# Altium schematic sheet a0206-2006.2.SchDoc
size 558 x 431 mm
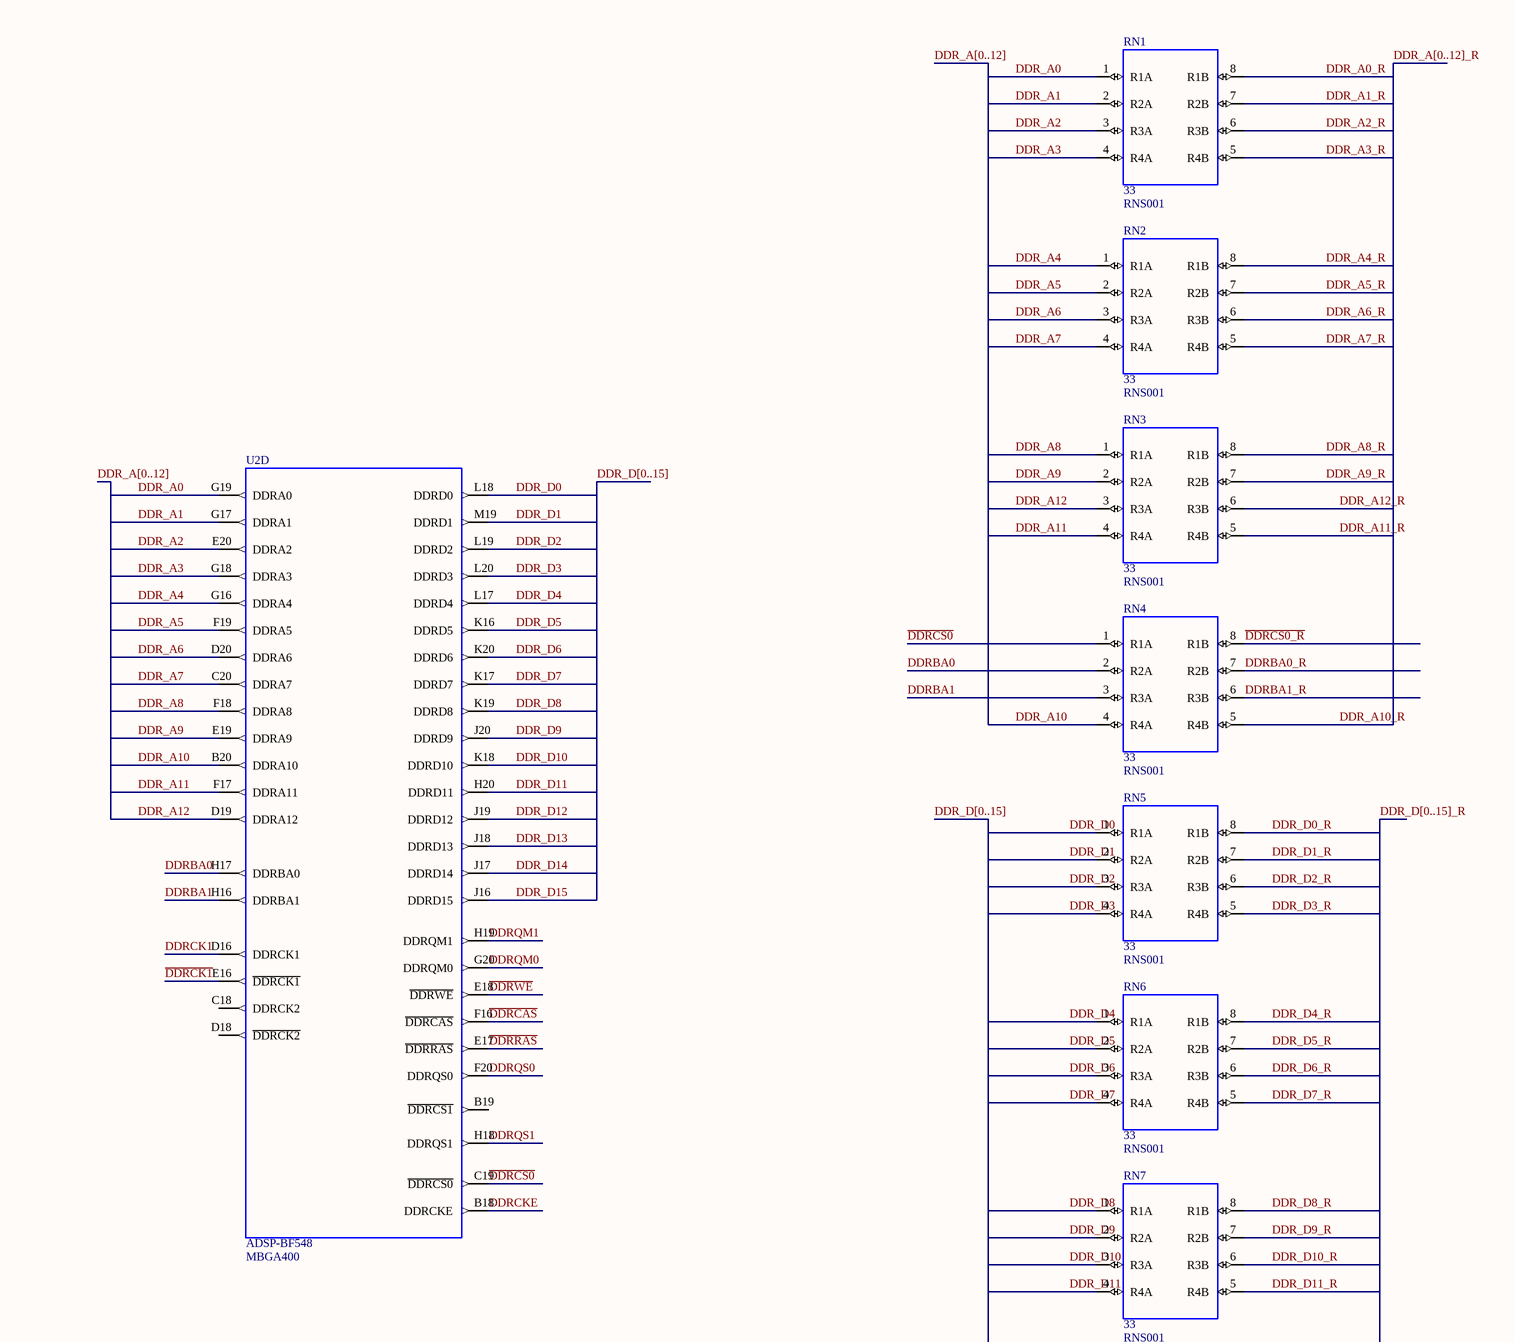
[diagram p0: a0206-2006.2.SchDoc, top left]
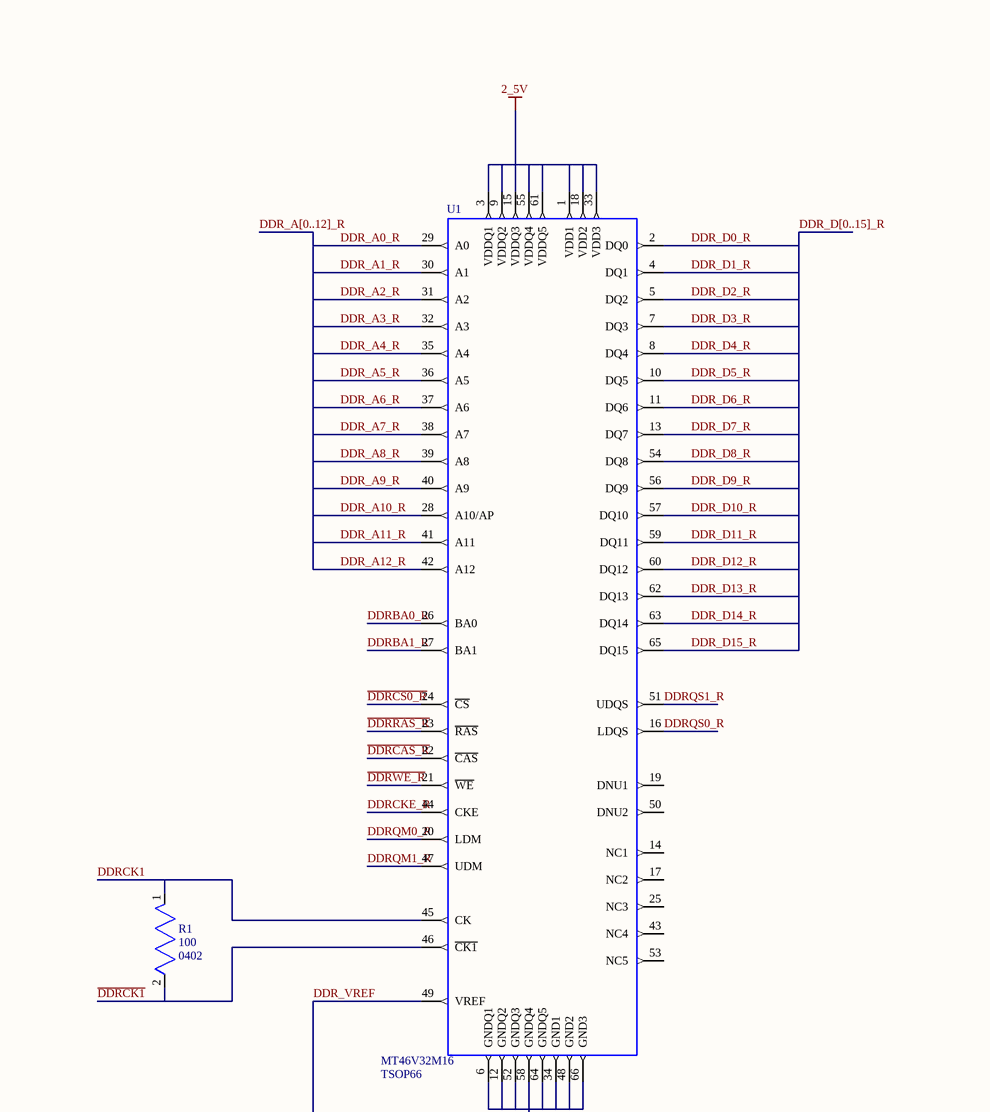
[diagram p1: a0206-2006.2.SchDoc, top right]
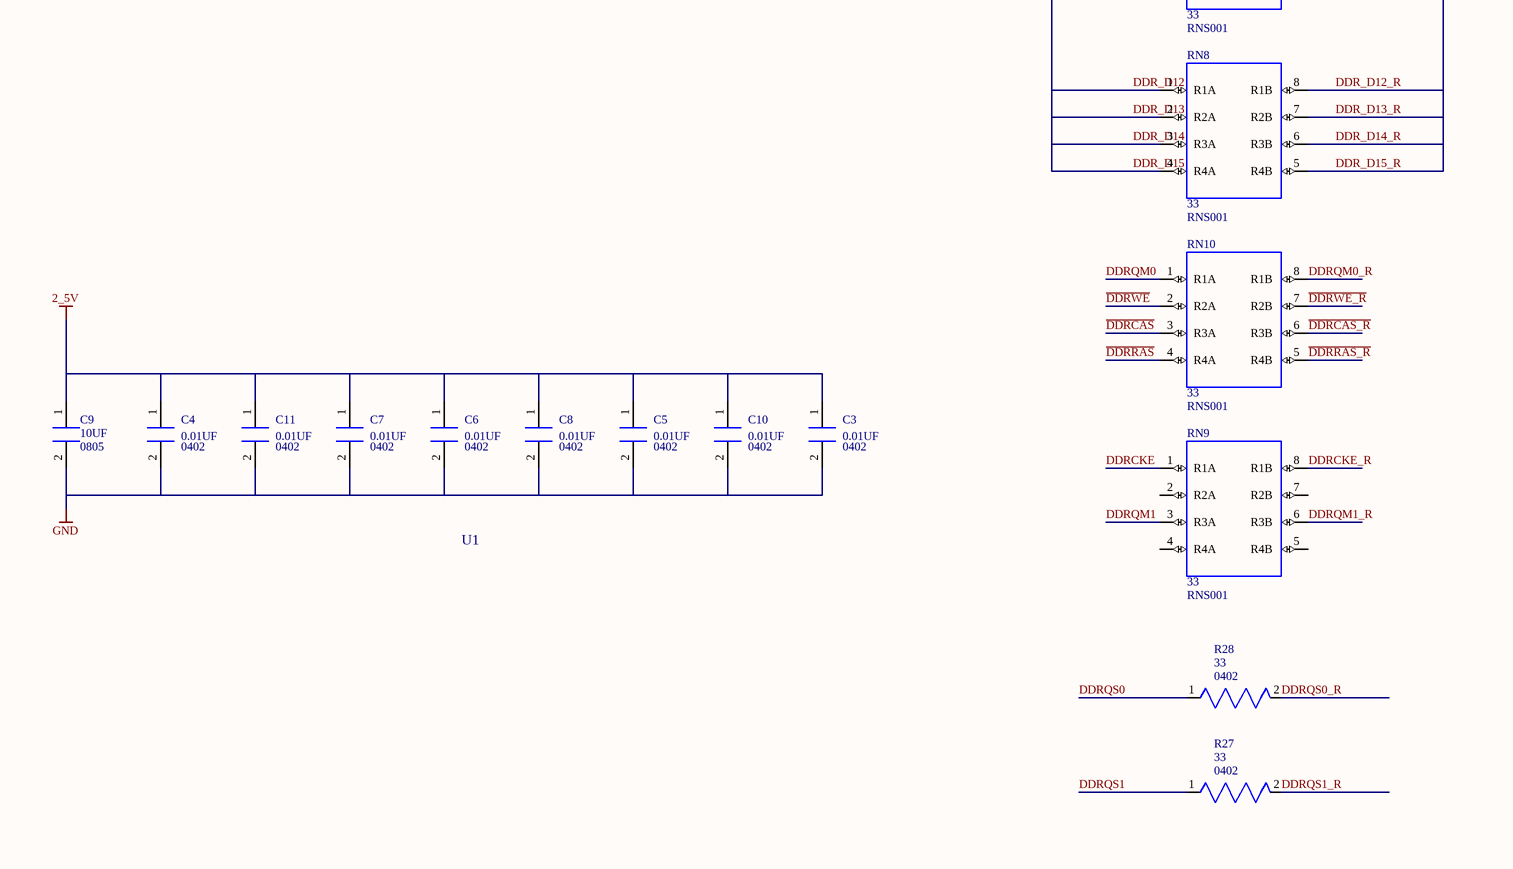
[diagram p2: a0206-2006.2.SchDoc, bottom left]
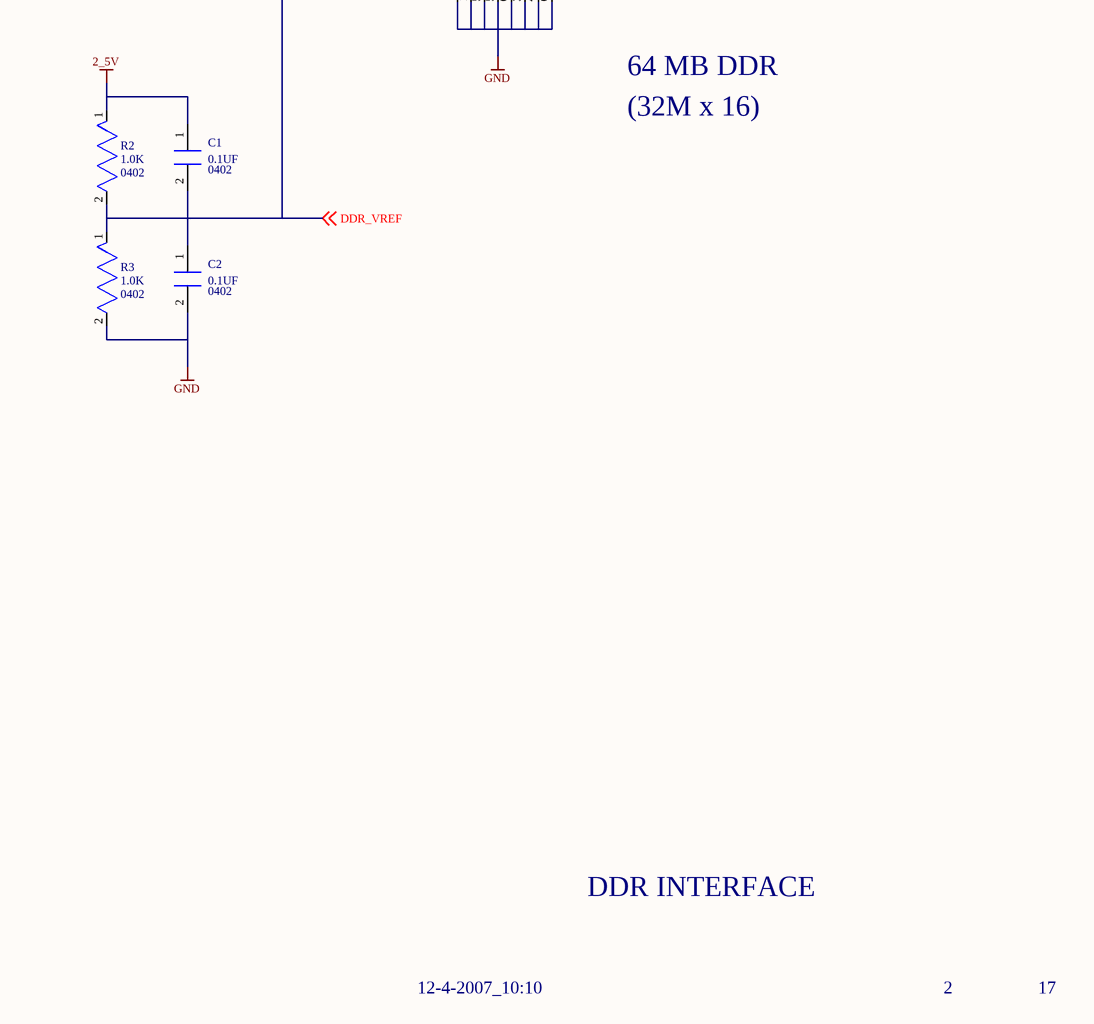
[diagram p3: a0206-2006.2.SchDoc, bottom right]

## Parts
C1  value 0.1UF  [0402]  (hidden comment: *)
C2  value 0.1UF  [0402]  (hidden comment: *)
C3  value 0.01UF  [0402]  (hidden comment: *)
C4  value 0.01UF  [0402]  (hidden comment: *)
C5  value 0.01UF  [0402]  (hidden comment: *)
C6  value 0.01UF  [0402]  (hidden comment: *)
C7  value 0.01UF  [0402]  (hidden comment: *)
C8  value 0.01UF  [0402]  (hidden comment: *)
C9  value 10UF  [0805]  (hidden comment: *)
C10  value 0.01UF  [0402]  (hidden comment: *)
C11  value 0.01UF  [0402]  (hidden comment: *)
R1  value 100  [0402]  (hidden comment: *)
R2  value 1.0K  [0402]  (hidden comment: *)
R3  value 1.0K  [0402]  (hidden comment: *)
R27  value 33  [0402]  (hidden comment: *)
R28  value 33  [0402]  (hidden comment: *)
RN1  value 33  [RNS001]  (hidden comment: *)
RN2  value 33  [RNS001]  (hidden comment: *)
RN3  value 33  [RNS001]  (hidden comment: *)
RN4  value 33  [RNS001]  (hidden comment: *)
RN5  value 33  [RNS001]  (hidden comment: *)
RN6  value 33  [RNS001]  (hidden comment: *)
RN7  value 33  [RNS001]  (hidden comment: *)
RN8  value 33  [RNS001]  (hidden comment: *)
RN9  value 33  [RNS001]  (hidden comment: *)
RN10  value 33  [RNS001]  (hidden comment: *)
U1  PART: MT46V32M16  [TSOP66]  (hidden comment: *)
U2  PART: ADSP-BF548  PKG_TYPE: MBGA400  (hidden comment: ICS_ADSPBF548)  (part D of 7)

## Nets
2_5V: C1.1(A) C3.1(A) C4.1(A) C5.1(A) C6.1(A) C7.1(A) C8.1(A) C9.1(A) C10.1(A) C11.1(A) R2.1(N1) U1.1(VDD1) U1.3(VDDQ1) U1.9(VDDQ2) U1.15(VDDQ3) U1.18(VDD2) U1.33(VDD3) U1.55(VDDQ4) U1.61(VDDQ5)
GND: C2.2(B) C3.2(B) C4.2(B) C5.2(B) C6.2(B) C7.2(B) C8.2(B) C9.2(B) C10.2(B) C11.2(B) R3.2(N2) U1.6(GNDQ1) U1.12(GNDQ2) U1.34(GND1) U1.48(GND2) U1.52(GNDQ3) U1.58(GNDQ4) U1.64(GNDQ5) U1.66(GND3)
~{DDRCAS}: RN10.3(R3A) U2.F16(~{DDRCAS})
~{DDRCAS_R}: RN10.6(R3B) U1.22(~{CAS})
~{DDRCK1}: R1.2(N2) U1.46(~{CK1}) U2.E16(~{DDRCK1})
~{DDRCS0}: RN4.1(R1A) U2.C19(~{DDRCS0})
~{DDRCS0_R}: RN4.8(R1B) U1.24(~{CS})
~{DDRRAS}: RN10.4(R4A) U2.E17(~{DDRRAS})
~{DDRRAS_R}: RN10.5(R4B) U1.23(~{RAS})
~{DDRWE}: RN10.2(R2A) U2.E18(~{DDRWE})
~{DDRWE_R}: RN10.7(R2B) U1.21(~{WE})
DDR_A0: RN1.1(R1A) U2.G19(DDRA0)
DDR_A0_R: RN1.8(R1B) U1.29(A0)
DDR_A1: RN1.2(R2A) U2.G17(DDRA1)
DDR_A1_R: RN1.7(R2B) U1.30(A1)
DDR_A2: RN1.3(R3A) U2.E20(DDRA2)
DDR_A2_R: RN1.6(R3B) U1.31(A2)
DDR_A3: RN1.4(R4A) U2.G18(DDRA3)
DDR_A3_R: RN1.5(R4B) U1.32(A3)
DDR_A4: RN2.1(R1A) U2.G16(DDRA4)
DDR_A4_R: RN2.8(R1B) U1.35(A4)
DDR_A5: RN2.2(R2A) U2.F19(DDRA5)
DDR_A5_R: RN2.7(R2B) U1.36(A5)
DDR_A6: RN2.3(R3A) U2.D20(DDRA6)
DDR_A6_R: RN2.6(R3B) U1.37(A6)
DDR_A7: RN2.4(R4A) U2.C20(DDRA7)
DDR_A7_R: RN2.5(R4B) U1.38(A7)
DDR_A8: RN3.1(R1A) U2.F18(DDRA8)
DDR_A8_R: RN3.8(R1B) U1.39(A8)
DDR_A9: RN3.2(R2A) U2.E19(DDRA9)
DDR_A9_R: RN3.7(R2B) U1.40(A9)
DDR_A10: RN4.4(R4A) U2.B20(DDRA10)
DDR_A10_R: RN4.5(R4B) U1.28(A10/AP)
DDR_A11: RN3.4(R4A) U2.F17(DDRA11)
DDR_A11_R: RN3.5(R4B) U1.41(A11)
DDR_A12: RN3.3(R3A) U2.D19(DDRA12)
DDR_A12_R: RN3.6(R3B) U1.42(A12)
DDR_D0: RN5.1(R1A) U2.L18(DDRD0)
DDR_D0_R: RN5.8(R1B) U1.2(DQ0)
DDR_D1: RN5.2(R2A) U2.M19(DDRD1)
DDR_D1_R: RN5.7(R2B) U1.4(DQ1)
DDR_D2: RN5.3(R3A) U2.L19(DDRD2)
DDR_D2_R: RN5.6(R3B) U1.5(DQ2)
DDR_D3: RN5.4(R4A) U2.L20(DDRD3)
DDR_D3_R: RN5.5(R4B) U1.7(DQ3)
DDR_D4: RN6.1(R1A) U2.L17(DDRD4)
DDR_D4_R: RN6.8(R1B) U1.8(DQ4)
DDR_D5: RN6.2(R2A) U2.K16(DDRD5)
DDR_D5_R: RN6.7(R2B) U1.10(DQ5)
DDR_D6: RN6.3(R3A) U2.K20(DDRD6)
DDR_D6_R: RN6.6(R3B) U1.11(DQ6)
DDR_D7: RN6.4(R4A) U2.K17(DDRD7)
DDR_D7_R: RN6.5(R4B) U1.13(DQ7)
DDR_D8: RN7.1(R1A) U2.K19(DDRD8)
DDR_D8_R: RN7.8(R1B) U1.54(DQ8)
DDR_D9: RN7.2(R2A) U2.J20(DDRD9)
DDR_D9_R: RN7.7(R2B) U1.56(DQ9)
DDR_D10: RN7.3(R3A) U2.K18(DDRD10)
DDR_D10_R: RN7.6(R3B) U1.57(DQ10)
DDR_D11: RN7.4(R4A) U2.H20(DDRD11)
DDR_D11_R: RN7.5(R4B) U1.59(DQ11)
DDR_D12: RN8.1(R1A) U2.J19(DDRD12)
DDR_D12_R: RN8.8(R1B) U1.60(DQ12)
DDR_D13: RN8.2(R2A) U2.J18(DDRD13)
DDR_D13_R: RN8.7(R2B) U1.62(DQ13)
DDR_D14: RN8.3(R3A) U2.J17(DDRD14)
DDR_D14_R: RN8.6(R3B) U1.63(DQ14)
DDR_D15: RN8.4(R4A) U2.J16(DDRD15)
DDR_D15_R: RN8.5(R4B) U1.65(DQ15)
DDR_VREF: C1.2(B) C2.1(A) R2.2(N2) R3.1(N1) U1.49(VREF) ; off-sheet DDR_VREF
DDRBA0: RN4.2(R2A) U2.H17(DDRBA0)
DDRBA0_R: RN4.7(R2B) U1.26(BA0)
DDRBA1: RN4.3(R3A) U2.H16(DDRBA1)
DDRBA1_R: RN4.6(R3B) U1.27(BA1)
DDRCK1: R1.1(N1) U1.45(CK) U2.D16(DDRCK1)
DDRCKE: RN9.1(R1A) U2.B18(DDRCKE)
DDRCKE_R: RN9.8(R1B) U1.44(CKE)
DDRQM0: RN10.1(R1A) U2.G20(DDRQM0)
DDRQM0_R: RN10.8(R1B) U1.20(LDM)
DDRQM1: RN9.3(R3A) U2.H19(DDRQM1)
DDRQM1_R: RN9.6(R3B) U1.47(UDM)
DDRQS0: R28.1(N1) U2.F20(DDRQS0)
DDRQS0_R: R28.2(N2) U1.16(LDQS)
DDRQS1: R27.1(N1) U2.H18(DDRQS1)
DDRQS1_R: R27.2(N2) U1.51(UDQS)

Not connected (* = marked no-connect by the designer): RN9 2(R2A) 4(R4A) 5(R4B) 7(R2B); U1 14(NC1) 17(NC2) 19(DNU1) 25(NC3) 43(NC4) 50(DNU2) 53(NC5); U2 B19(~{DDRCS1}) C18(DDRCK2) D18(~{DDRCK2})

## Buses and harness runs
bus DDR_A[0..12]
bus DDR_A[0..12]_R
bus DDR_D[0..15]
bus DDR_D[0..15]_R

## Notes on the sheet
- 64 MB DDR
- (32M x 16)
- U1
- DDR INTERFACE
- 12-4-2007_10:10
- 2
- 17
- A
- B
- C
- D
- 1
- 3
- 20 Cotton Road
- 4
- DEVICES
- ANALOG
- Nashua, NH 03063
- PH: 1-800-ANALOGD
- Title
- ADSP-BF548 EZ-KIT LITE
- Size
- Board No.
- A0206-2006
- Rev
- 1.4B
- Date
- Sheet
- of

## Library data of the parts
C1 = CAP_NON_POLARIZED.2: PART_SPEC: CAPACITOR; LEVEL: STD; TOLERANCE: 10%; VOLTAGE: 10V; TYPE: X5R; PRT_NUM: 7000278; PKG_TYPE: 0402; ROHS: ROHS
C2 = CAP_NON_POLARIZED.2: PART_SPEC: CAPACITOR; LEVEL: STD; PRT_NUM: 7000278; TYPE: X5R; VOLTAGE: 10V; TOLERANCE: 10%; PKG_TYPE: 0402; ROHS: ROHS
C3 C4 = CAP_NON_POLARIZED.2: PART_SPEC: CAPACITOR; LEVEL: STD; PRT_NUM: 7000279; VOLTAGE: 16V; TOLERANCE: 10%; BOARDS: BOTH; TYPE: X7R; PKG_TYPE: 0402; ROHS: ROHS
C5 C6 = CAP_NON_POLARIZED.2: PART_SPEC: CAPACITOR; LEVEL: STD; TYPE: X7R; BOARDS: BOTH; PRT_NUM: 7000279; VOLTAGE: 16V; TOLERANCE: 10%; PKG_TYPE: 0402; ROHS: ROHS
C7 C8 C10 C11 = CAP_NON_POLARIZED.2: PART_SPEC: CAPACITOR; LEVEL: STD; TYPE: X7R; BOARDS: BOTH; TOLERANCE: 10%; VOLTAGE: 16V; PRT_NUM: 7000279; PKG_TYPE: 0402; ROHS: ROHS
C9 = CAP_NON_POLARIZED.2: PART_SPEC: CAPACITOR; LEVEL: STD; TYPE: X5R; PRT_NUM: 7000265; VOLTAGE: 6.3V; TOLERANCE: 10%; BOARDS: BOTH; PKG_TYPE: 0805; ROHS: ROHS
R1 = RES_STANDARD.2: PART_SPEC: RESISTOR; LEVEL: STD; BOARDS: BOTH; PRT_NUM: 7000432; TOLERANCE: 5%; POWER: 1/16W; PKG_TYPE: 0402; ROHS: ROHS
R2 = RES_STANDARD.2: PART_SPEC: RESISTOR; LEVEL: STD; PRT_NUM: 7000571; TOLERANCE: 1%; POWER: 1/16W; PKG_TYPE: 0402; ROHS: ROHS
R3 = RES_STANDARD.2: PART_SPEC: RESISTOR; LEVEL: STD; PRT_NUM: 7000571; POWER: 1/16W; TOLERANCE: 1%; PKG_TYPE: 0402; ROHS: ROHS
R27 = RES_STANDARD.1: PART_SPEC: RESISTOR; LEVEL: STD; PRT_NUM: 7000285; POWER: 1/16W; TOLERANCE: 5%; PKG_TYPE: 0402; ROHS: ROHS
R28 = RES_STANDARD.1: PART_SPEC: RESISTOR; LEVEL: STD; TOLERANCE: 5%; POWER: 1/16W; PRT_NUM: 7000285; PKG_TYPE: 0402; ROHS: ROHS
RN1 RN3 RN6 RN8 RN10 = RNET_4SERIES.1: SERIES; PART_SPEC: RESISTOR_NETWORK; LEVEL: STD; PRT_NUM: 7000558; TOLERANCE: 5%; POWER: 125MW; PKG_TYPE: RNS001; ROHS: ROHS
RN2 RN4 RN5 RN7 RN9 = RNET_4SERIES.1: SERIES; PART_SPEC: RESISTOR_NETWORK; LEVEL: STD; PRT_NUM: 7000558; POWER: 125MW; TOLERANCE: 5%; PKG_TYPE: RNS001; ROHS: ROHS
U1 = ICS_MT46V32M16.1: 8MX16X4 DDR SDRAM; LEVEL: STD; PRT_NUM: 1000423; PKG_TYPE: TSOP66; WEB: http://www.micron.com/products/partdetail?part; ROHS: ROHS
U2 = ICS_ADSPBF548_A: 600 MHZ; LEVEL: STD; PRT_NUM: 30-025548-02; DEVICE: ICS_ADSPBF548; ROHS: ROHS; WEB: http://www.analog.com/en/prod/0,2877,ADSP%252DBF548,00.html